# Altium schematic sheet LambdaWidebandController.SchDoc: Controle da sonda lambda
size 420 x 297 mm; Author: Matheus Markies; DrawnBy: Matheus Markies; Engineer: Matheus Markies; DocumentNumber: ECTU-SCH-08; Revision: A definir; SheetNumber: 8; SheetTotal: 12; ProjectTitle: ROUTE ECU / ECTU; DocumentStatus: Em desenvolvimento; DocumentDate: 14/10/2026
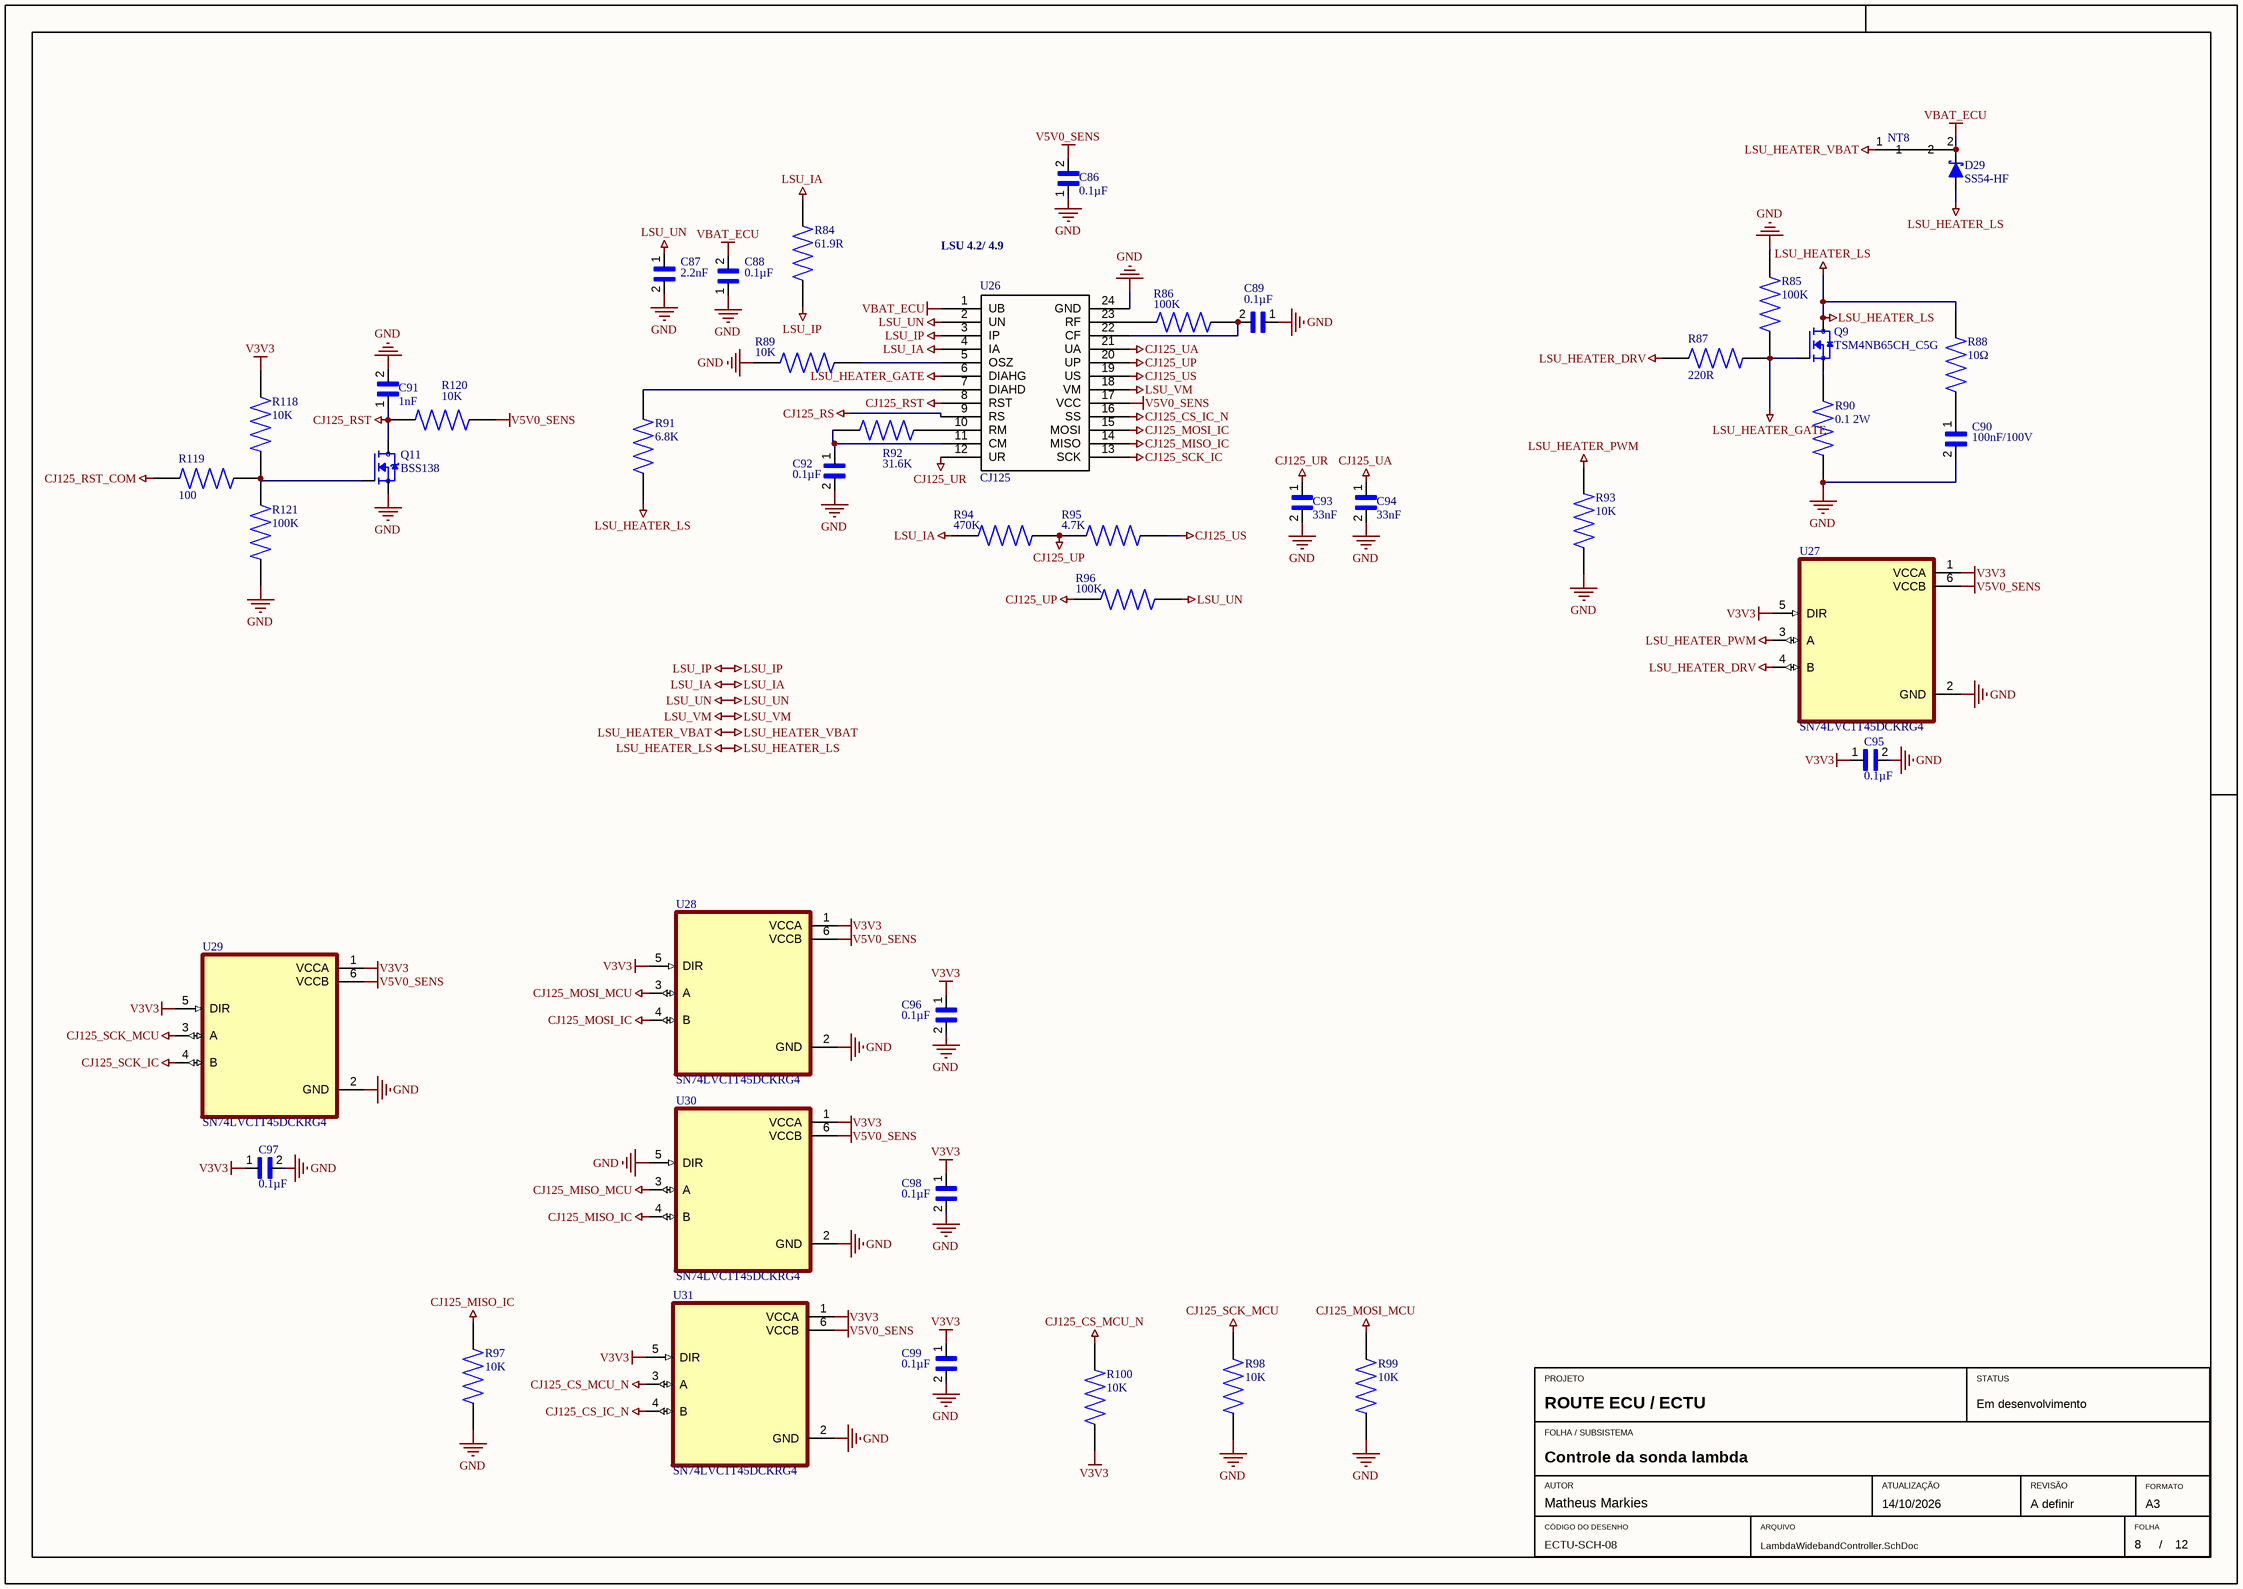
[diagram p0: LambdaWidebandController.SchDoc]

## Parts
C86  0.1µF  [CAPC1608X90N]
C87  2.2nF  [CAPC1608X90N]
C88  0.1µF  [CAPC1608X90N]
C89  0.1µF  [CAPC1608X90N]
C90  100nF/100V  [CAPC1608X90N]
C91  1nF  [CAPC1608X90N]
C92  0.1µF  [CAPC1608X90N]
C93  33nF  [CAPC1608X90N]
C94  33nF  [CAPC1608X90N]
C95  0.1µF  [CAPC1608X90N]
C96  0.1µF  [CAPC1608X90N]
C97  0.1µF  [CAPC1608X90N]
C98  0.1µF  [CAPC1608X90N]
C99  0.1µF  [CAPC1608X90N]
D29  SS54-HF  [DIOM5025X220N]
NT8  (no value)  [NetTie]  (net tie, no BOM)
Q9  TSM4NB65CH_C5G  [TO228P680X240X837-3]
Q11  BSS138  [SOT95P240X111-3N]
R84  61.9R  [RESC3116X65N]
R85  100K  [RESC3116X65N]
R86  100K  [RESC3116X65N]
R87  220R  [RESC3116X65N]
R88  10Ω  [RESC3116X65N]
R89  10K  [RESC3116X65N]
R90  0.1 2W  [RESC6331X80N]
R91  6.8K  [RESC3116X65N]
R92  31.6K  [RESC3116X65N]
R93  10K  [RESC3116X65N]
R94  470K  [RESC3116X65N]
R95  4.7K  [RESC3116X65N]
R96  100K  [RESC3116X65N]
R97  10K  [RESC3116X65N]
R98  10K  [RESC3116X65N]
R99  10K  [RESC3116X65N]
R100  10K  [RESC3116X65N]
R118  10K  [RESC3116X65N]
R119  100  [RESC3116X65N]
R120  10K  [RESC3116X65N]
R121  100K  [RESC3116X65N]
U26  CJ125  [CJ125]
U27  SN74LVC1T45DCKRG4  [SOT65P210X110-6N]
U28  SN74LVC1T45DCKRG4  [SOT65P210X110-6N]
U29  SN74LVC1T45DCKRG4  [SOT65P210X110-6N]
U30  SN74LVC1T45DCKRG4  [SOT65P210X110-6N]
U31  SN74LVC1T45DCKRG4  [SOT65P210X110-6N]

## Nets
CJ125_CS_IC_N: U26.16(SS) U31.4(B)
CJ125_CS_MCU_N: R100.2 U31.3(A)
CJ125_MISO_IC: R97.2 U26.14(MISO) U30.4(B)
CJ125_MISO_MCU: U30.3(A)
CJ125_MOSI_IC: U26.15(MOSI) U28.4(B)
CJ125_MOSI_MCU: R99.2 U28.3(A)
CJ125_RS: U26.9(RS)
CJ125_RST: C91.1 Q11.3(D) R120.1 U26.8(RST)
CJ125_RST_COM: R119.1
CJ125_SCK_IC: U26.13(SCK) U29.4(B)
CJ125_SCK_MCU: R98.2 U29.3(A)
CJ125_UA: C94.1 U26.21(UA)
CJ125_UP: R94.2 R95.1 R96.1 U26.20(UP)
CJ125_UR: C93.1 U26.12(UR)
CJ125_US: R95.2 U26.19(US)
GND: C86.1 C87.2 C88.1 C89.1 C90.2 C91.2 C92.2 C93.2 C94.2 C95.2 C96.2 C97.2 C98.2 C99.2 Q11.2(S) R85.2 R89.1 R90.2 R93.1 R97.1 R98.1 R99.1 R121.2 U26.24(GND) U27.2(GND) U28.2(GND) U29.2(GND) U30.2(GND) U30.5(DIR) U31.2(GND)
LSU_HEATER_DRV: R87.1 U27.4(B)
LSU_HEATER_GATE: Q9.1(G) R85.1 R87.2 U26.6(DIAHG)
LSU_HEATER_LS: D29.2(A) Q9.2(D) R88.2 R91.1
LSU_HEATER_PWM: R93.2 U27.3(A)
LSU_HEATER_VBAT: NT8.1
LSU_IA: R84.1 R94.1 U26.4(IA)
LSU_IP: R84.2 U26.3(IP)
LSU_UN: C87.1 R96.2 U26.2(UN)
LSU_VM: U26.18(VM)
V3V3: C95.1 C96.1 C97.1 C98.1 C99.1 R100.1 R118.1 U27.1(VCCA) U27.5(DIR) U28.1(VCCA) U28.5(DIR) U29.1(VCCA) U29.5(DIR) U30.1(VCCA) U31.1(VCCA) U31.5(DIR)
V5V0_SENS: C86.2 R120.2 U26.17(VCC) U27.6(VCCB) U28.6(VCCB) U29.6(VCCB) U30.6(VCCB) U31.6(VCCB)
VBAT_ECU: C88.2 D29.1(K) NT8.2 U26.1(UB)
NetC89_2: C89.2 R86.2 U26.22(CF)
NetC90_1: C90.1 R88.1
NetC92_1: C92.1 R92.1 U26.11(CM)
NetQ9_3: Q9.3(S) R90.1
NetQ11_1: Q11.1(G) R118.2 R119.2 R121.1
NetR86_1: R86.1 U26.23(RF)
NetR89_2: R89.2 U26.5(OSZ)
NetR91_2: R91.2 U26.7(DIAHD)
NetR92_2: R92.2 U26.10(RM)

## Notes on the sheet
- LSU 4.2/ 4.9
- PROJETO
- STATUS
- FOLHA / SUBSISTEMA
- AUTOR
- CÓDIGO DO DESENHO
- ARQUIVO
- ATUALIZAÇÃO
- REVISÃO
- FOLHA
- FORMATO
- A3
- /

## Library data of the parts
C86-C99 = 06035C104MAZ2A: Multilayer Ceramic Capacitors MLCC - SMD/SMT; Package: None; Price: None; Value: *; MP: 06035C104MAZ2A; Availability: Unavailable
D29 = SS54-HF: Diode Schottky 40 V 5A Surface Mount DO-214AC (SMA); MF: Comchip Technology; SnapEDA_Link: https://www.snapeda.com/parts/SS54-HF/Comchip/view-part/?ref=snap; Package: DO-214AC-214 Comchip Technology; Value: *; MP: SS54-HF; Check_prices: https://www.snapeda.com/parts/SS54-HF/Comchip/view-part/?ref=eda
NT8 = NT
Q9 = TSM4NB65CH_C5G: 650V, 4A, Single N-Channel Power MOSFET; MF: Taiwan Semiconductor; MP: TSM4NB65CH C5G; SnapEDA_Link: https://www.snapeda.com/parts/TSM4NB65CH%20C5G/Taiwan+Semiconductor/view-part/?ref=snap; Package: TO-251 Taiwan Semiconductor; Value: *; Check_prices: https://www.snapeda.com/parts/TSM4NB65CH%20C5G/Taiwan+Semiconductor/view-part/?ref=eda
Q11 = BSS138: N-Channel 50 V 220mA (Ta) 350mW (Ta) Surface Mount SOT-23-3; MF: onsemi; SnapEDA_Link: https://www.snapeda.com/parts/BSS138/Onsemi/view-part/?ref=snap; Package: SOT-23-3 ON Semiconductor; Value: *; MP: BSS138; Check_prices: https://www.snapeda.com/parts/BSS138/Onsemi/view-part/?ref=eda
R84-R89 R91-R100 R118-R121 = AA1206JR-07470RL: Package: None; Price: None; Value: *; MP: AA1206JR-07470RL; Availability: Unavailable
R90 = CRM2512-JX-R100ELF: Resistor,Thick Film,Res 0.1 Ohms,Pwr-Rtg 2 W,Tol 5%,SMT,2512 | Bourns CRM2512-JX-R100ELF; SnapEDA_Link: https://www.snapeda.com/parts/CRM2512-JX-R100ELF/Bourns/view-part/?ref=snap; Package: 6331 Bourns; Value: *; MF: Bourns; MP: CRM2512-JX-R100ELF; Check_prices: https://www.snapeda.com/parts/CRM2512-JX-R100ELF/Bourns/view-part/?ref=eda
U27-U31 = SN74LVC1T45DCKRG4: Single-Bit Dual-Supply Bus Transceiver with Configurable Voltage-Level Shifting and 3-State Outputs 6-SC70 -40 to 85; MF: Texas Instruments; SnapEDA_Link: https://www.snapeda.com/parts/SN74LVC1T45DCKRG4/Texas+Instruments/view-part/?ref=snap; Package: SOT-SC70-6 Texas Instruments; Value: *; MP: SN74LVC1T45DCKRG4; Check_prices: https://www.snapeda.com/parts/SN74LVC1T45DCKRG4/Texas+Instruments/view-part/?ref=eda